# Altium schematic sheet OUTPUT.SchDoc
size A4; SheetNumber: 5; SheetTotal: 5
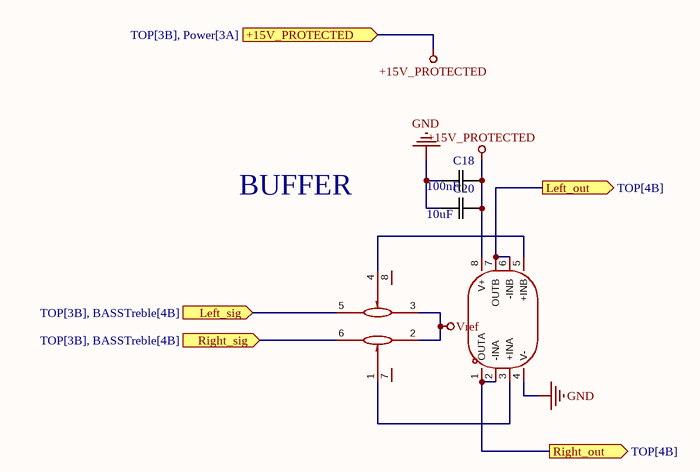
[diagram p0: OUTPUT.SchDoc]

## Parts
C18  100nF  [0603 Cap - C0G]
C20  10uF  [0805 CAP - C0G]
U11  rk12l12c0a0e  [LOG Potentiometer]  (value not drawn)
U12  opa1656idr  [OPA1656IDR]  (value not drawn)

## Ports
+15V_PROTECTED (in, see TOP[3B], Power[3A]), Left_out (out, see TOP[4B]), Left_sig (in, see TOP[3B], BASSTreble[4B]), Right_out (out, see TOP[4B]), Right_sig (in, see TOP[3B], BASSTreble[4B])

## Nets
+15V_PROTECTED: C18.2 C20.2 U12.8(V+) ; port +15V_PROTECTED
GND: C18.1 C20.1 U12.4(V-)
Vref: U11.2 U11.3
Left_out: U12.6(-INB) U12.7(OUTB) ; port Left_out
Left_sig: U11.5 ; port Left_sig
Right_out: U12.1(OUTA) U12.2(-INA) ; port Right_out
Right_sig: U11.6 ; port Right_sig
NetU11_1: U11.1 U12.3(+INA)
NetU11_4: U11.4 U12.5(+INB)

Not connected (* = marked no-connect by the designer): U11 7(EH) 8(EH)

## Notes on the sheet
- BUFFER

## Library data of the parts
C18 C20 = CAP_CERAMIC: Manufacturer_Name: Kemet; Manufacturer_Part_Number: C0603C104K5RACTU; Copyright: Copyright (C) 2026 Ultra Librarian. All rights reserved.
U11 = LOG Potentiometer: Resistance: Tolerance:±20% Tolerance:±20% Rated Voltage: Power(Watts):50mW Turns:-; Manufacturer: ALPSALPINE(阿尔卑斯阿尔派); AddInBom: yes; ModelId: 34e0376d5eee43e6a3b83596b84c8b47; ModelName: RES-ADJ-TH_RK12L1230C1M; ModelTransform: 535.43082,681.101,0,0,0,0,-0.004,112.202,-145.669; Value: 10kΩ; Tolerance: ±20%; Power(Watts): 50mW; Symbol: RK12L12C0A0E; LCSC Part Name: 10kΩ ±20%; SupplierPart: C470285; ManufacturerPart: RK12L12C0A0E; Supplier Footprint: 插件-6P,15.5x12mm; JLCPCB Part Class: Extended Part; Datasheet: https://atta.szlcsc.com/upload/public/pdf/source/20191216/C470380_93C0132B2AE7BA8B014CE4021E4797E4.pdf; Supplier: LCSC; ConvertToPcb: yes; FootprintName: RES-ADJ-TH_RK12L1230C1M; Turns: -
U12 = opa1656idr: Number of Channels:2 Gain Bandwidth Product:53MHz Ib - Input Bias Current:20pA Vos - Input Offset Voltage:1mV Common Mode Rejection Ratio(CMRR):120dB Slew Rate:24V/us Quiescent Current(Iq):3.9mA Rail To Rail:Rail-to-rail output Input Offset Voltage Drift(; Manufacturer: TI(德州仪器); AddInBom: yes; ModelId: 2ec1ac1bf9bf4d09a988fcee15e6a02d; ModelName: SOIC-8_L4.9-W3.9-H1.7-LS6.0-P1.27; ModelTransform: 192.913,236.22,0,0,0,0,0,0,0; Number of Channels: 2; Gain Bandwidth Product: 53MHz; Ib - Input Bias Current: 20pA; Vos - Input Offset Voltage: 1mV; Common Mode Rejection Ratio(CMRR): 120dB; Slew Rate: 24V/us; Quiescent Current(Iq): 3.9mA; Input Offset Voltage Drift(Vos TC): 2uV/℃; Output Current: 100mA; Single Supply: 4.5V~36V; Dual Supply: -18V~-2.25V；2.25V~18V; Noise density(eN): 4.3nV/√Hz@1kHz; Symbol: OPA1656IDR; LCSC Part Name: 超低噪声、低失真、FET输入音频运算放大器; SupplierPart: C1849431; ManufacturerPart: OPA1656IDR; Supplier Footprint: SOIC-8; JLCPCB Part Class: Extended Part; Datasheet: https://www.ti.com/cn/lit/ds/symlink/opa1656.pdf; Supplier: LCSC; ConvertToPcb: yes; FootprintName: SOIC-8_L4.9-W3.9-P1.27-LS6.0-BL; Rail To Rail: Rail-to-rail output; Operating Temperature: -40℃~+125℃; Input Offset Current(Ios): 20pA